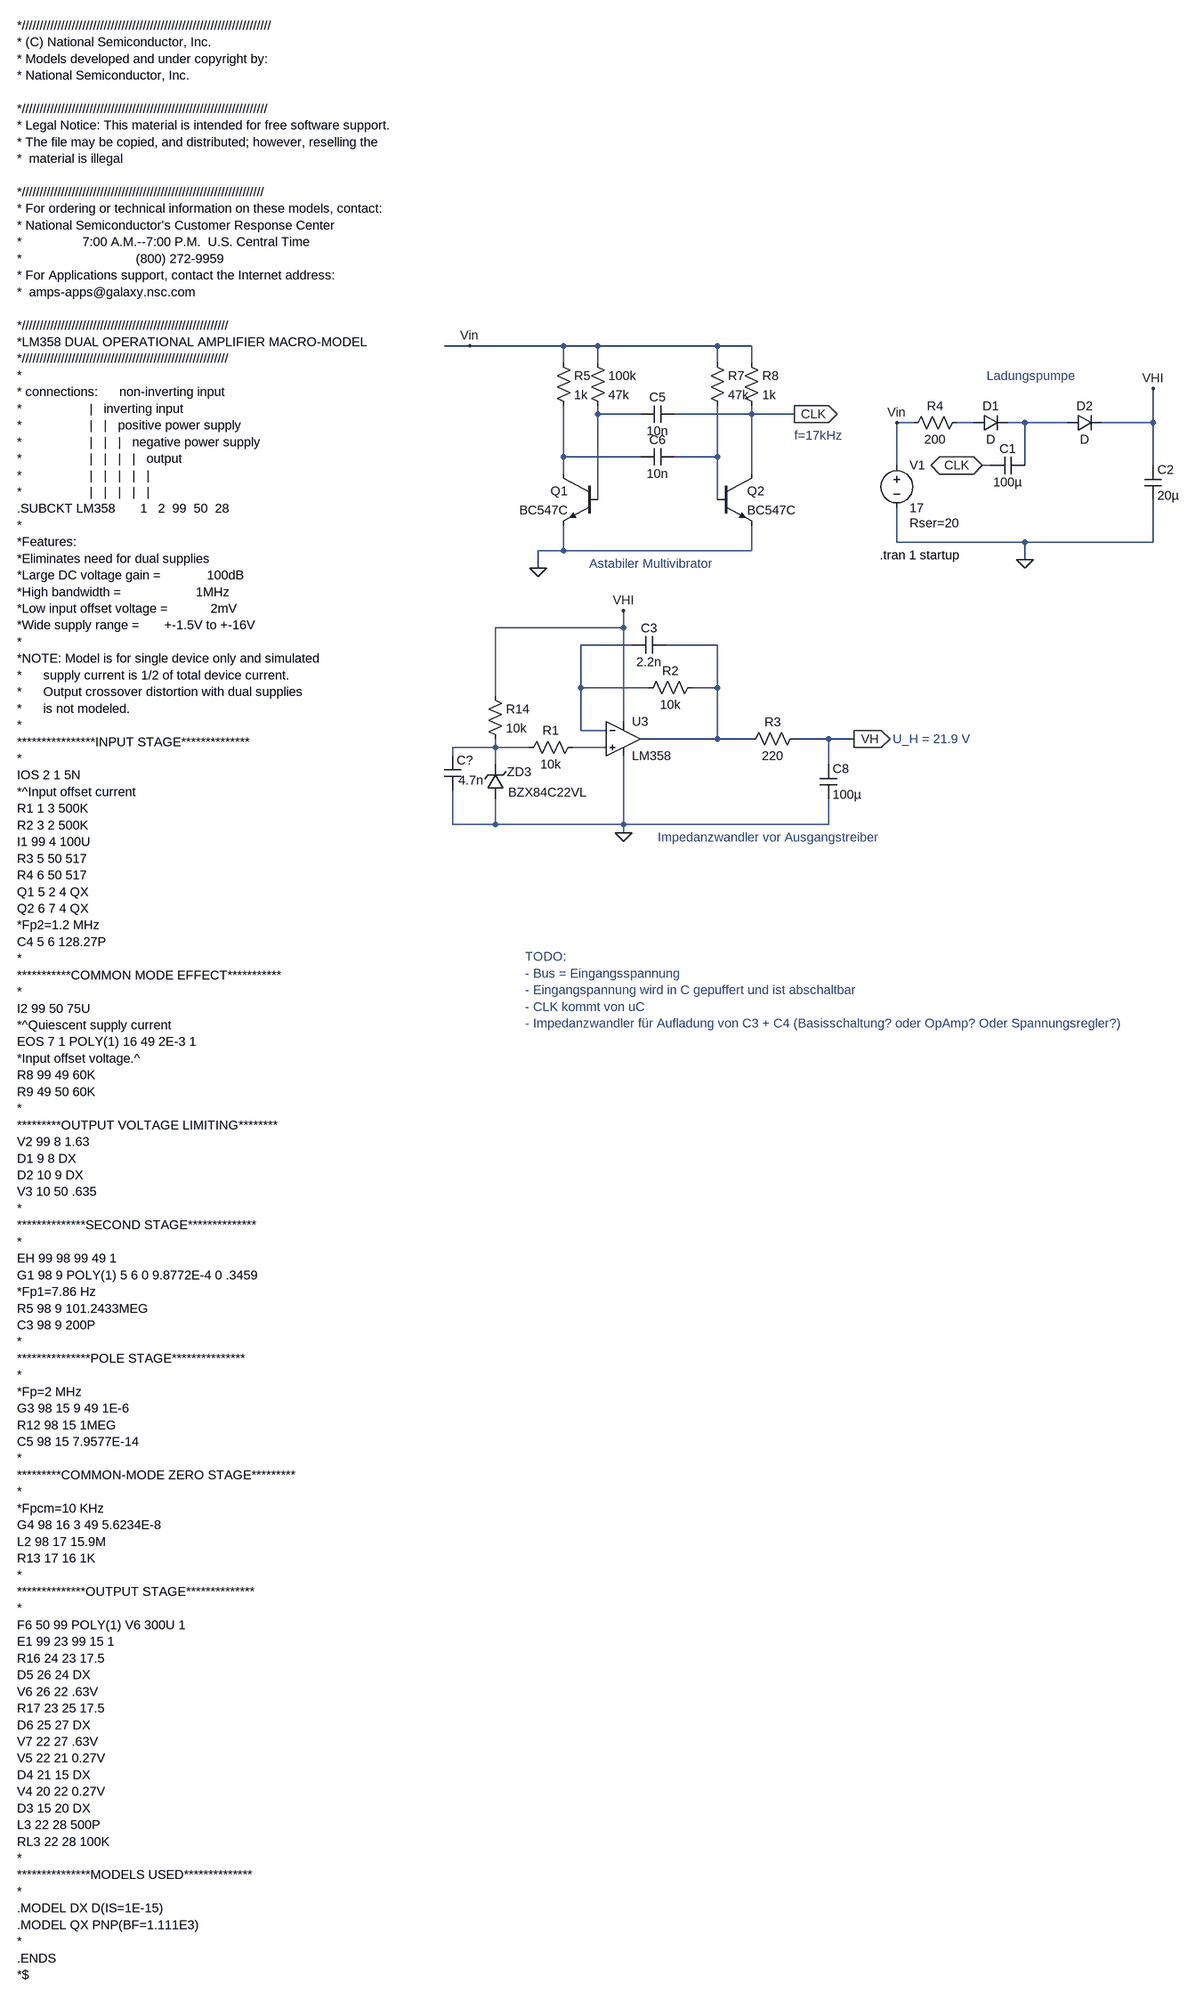
[diagram p0: schematic DriverC2.asc]
DriverC2.asc, the LTspice schematic file:
Version 4
SHEET 1 2516 2612
WIRE -768 -80 -816 -80
WIRE -592 -80 -768 -80
WIRE -528 -80 -592 -80
WIRE -304 -80 -528 -80
WIRE -240 -80 -304 -80
WIRE -592 -48 -592 -80
WIRE -528 -48 -528 -80
WIRE -304 -48 -304 -80
WIRE -240 -48 -240 -80
WIRE -528 48 -528 32
WIRE -448 48 -528 48
WIRE -240 48 -240 32
WIRE -240 48 -384 48
WIRE -160 48 -240 48
WIRE 64 64 32 64
WIRE 176 64 144 64
WIRE 272 64 240 64
WIRE 352 64 272 64
WIRE 512 64 512 0
WIRE 512 64 416 64
WIRE -592 128 -592 32
WIRE -448 128 -592 128
WIRE -304 128 -304 32
WIRE -304 128 -384 128
WIRE 32 144 32 64
WIRE 208 144 192 144
WIRE 272 144 272 64
WIRE 512 144 512 64
WIRE -592 160 -592 128
WIRE -240 160 -240 48
WIRE -528 208 -528 48
WIRE -304 208 -304 128
WIRE 32 288 32 224
WIRE 272 288 32 288
WIRE 512 288 512 208
WIRE 512 288 272 288
WIRE -592 304 -592 256
WIRE -592 304 -640 304
WIRE -240 304 -240 256
WIRE -240 304 -592 304
WIRE 272 320 272 288
WIRE -640 336 -640 304
WIRE -480 448 -480 416
WIRE -480 448 -720 448
WIRE -464 480 -560 480
WIRE -304 480 -400 480
WIRE -560 560 -560 480
WIRE -432 560 -560 560
WIRE -304 560 -304 480
WIRE -304 560 -352 560
WIRE -720 576 -720 448
WIRE -480 624 -480 448
WIRE -560 640 -560 560
WIRE -512 640 -560 640
WIRE -304 656 -304 560
WIRE -304 656 -448 656
WIRE -240 656 -304 656
WIRE -96 656 -160 656
WIRE -48 656 -96 656
WIRE -720 672 -720 656
WIRE -720 672 -800 672
WIRE -656 672 -720 672
WIRE -512 672 -576 672
WIRE -800 688 -800 672
WIRE -720 704 -720 672
WIRE -96 704 -96 656
WIRE -800 816 -800 752
WIRE -720 816 -720 768
WIRE -720 816 -800 816
WIRE -480 816 -480 688
WIRE -480 816 -720 816
WIRE -96 816 -96 768
WIRE -96 816 -480 816
WIRE -480 832 -480 816
FLAG 272 320 0
FLAG 192 144 CLK
IOPIN 192 144 BiDir
FLAG -640 336 0
FLAG -768 -80 Vin
FLAG 32 64 Vin
FLAG -160 48 CLK
IOPIN -160 48 Out
FLAG 512 0 VHI
FLAG -48 656 VH
IOPIN -48 656 Out
FLAG -480 416 VHI
FLAG -480 832 0
SYMBOL voltage 32 128 R0
WINDOW 123 0 0 Left 0
WINDOW 39 24 124 Left 2
SYMATTR SpiceLine Rser=20
SYMATTR InstName V1
SYMATTR Value 17
SYMBOL diode 176 80 R270
WINDOW 0 32 32 VTop 2
WINDOW 3 0 32 VBottom 2
SYMATTR InstName D1
SYMBOL diode 352 80 R270
WINDOW 0 32 32 VTop 2
WINDOW 3 0 32 VBottom 2
SYMATTR InstName D2
SYMBOL cap 272 128 R90
WINDOW 0 0 32 VBottom 2
WINDOW 3 32 32 VTop 2
SYMATTR InstName C1
SYMATTR Value 100µ
SYMBOL cap 496 144 R0
SYMATTR InstName C2
SYMATTR Value 20µ
SYMBOL res 160 48 R90
WINDOW 0 0 56 VBottom 2
WINDOW 3 32 56 VTop 2
SYMATTR InstName R4
SYMATTR Value 200
SYMBOL res -608 -64 R0
SYMATTR InstName R5
SYMATTR Value 1k
SYMBOL res -256 -64 R0
SYMATTR InstName R8
SYMATTR Value 1k
SYMBOL npn -528 160 M0
SYMATTR InstName Q1
SYMATTR Value BC547C
SYMBOL npn -304 160 R0
SYMATTR InstName Q2
SYMATTR Value BC547C
SYMBOL res -544 -64 R0
SYMATTR InstName 100k
SYMATTR Value 47k
SYMBOL res -320 -64 R0
SYMATTR InstName R7
SYMATTR Value 47k
SYMBOL cap -384 32 R90
WINDOW 0 0 32 VBottom 2
WINDOW 3 32 32 VTop 2
SYMATTR InstName C5
SYMATTR Value 10n
SYMBOL cap -384 112 R90
WINDOW 0 0 32 VBottom 2
WINDOW 3 32 32 VTop 2
SYMATTR InstName C6
SYMATTR Value 10n
SYMBOL Opamps\\opamp2 -480 592 R0
SYMATTR InstName U3
SYMATTR Value LM358
SYMATTR SpiceModel LM358
SYMBOL res -736 560 R0
SYMATTR InstName R14
SYMATTR Value 10k
SYMBOL cap -816 688 R0
WINDOW 3 27 46 Left 2
SYMATTR InstName C?
SYMATTR Value 4.7n
SYMBOL res -560 656 R90
WINDOW 0 0 56 VBottom 2
WINDOW 3 32 56 VTop 2
SYMATTR InstName R1
SYMATTR Value 10k
SYMBOL res -336 544 R90
WINDOW 0 0 56 VBottom 2
WINDOW 3 32 56 VTop 2
SYMATTR InstName R2
SYMATTR Value 10k
SYMBOL cap -112 704 R0
SYMATTR InstName C8
SYMATTR Value 100µ
SYMBOL res -144 640 R90
WINDOW 0 0 56 VBottom 2
WINDOW 3 32 56 VTop 2
SYMATTR InstName R3
SYMATTR Value 220
SYMBOL cap -400 464 R90
WINDOW 0 0 32 VBottom 2
WINDOW 3 32 32 VTop 2
SYMATTR InstName C3
SYMATTR Value 2.2n
SYMBOL zener -704 768 R180
WINDOW 0 -52 50 Left 2
WINDOW 3 -155 12 Left 2
SYMATTR InstName ZD3
SYMATTR Value BZX84C22VL
TEXT 0 312 Left 2 !.tran 1 startup
TEXT -544 328 Left 2 ;Astabiler Multivibrator
TEXT 200 -24 Left 2 ;Ladungspumpe
TEXT -160 88 Left 2 ;f=17kHz
TEXT -664 1064 Left 2 ;TODO: \n- Bus = Eingangsspannung\n- Eingangspannung wird in C gepuffert und ist abschaltbar\n- CLK kommt von uC\n- Impedanzwandler für Aufladung von C3 + C4 (Basisschaltung? oder OpAmp? Oder Spannungsregler?)
TEXT -2704 -680 Left 2 !*//////////////////////////////////////////////////////////////////////\n* (C) National Semiconductor, Inc.\n* Models developed and under copyright by:\n* National Semiconductor, Inc.  \n \n*/////////////////////////////////////////////////////////////////////\n* Legal Notice: This material is intended for free software support.\n* The file may be copied, and distributed; however, reselling the \n*  material is illegal\n \n*////////////////////////////////////////////////////////////////////\n* For ordering or technical information on these models, contact:\n* National Semiconductor's Customer Response Center\n*                 7:00 A.M.--7:00 P.M.  U.S. Central Time\n*                                (800) 272-9959\n* For Applications support, contact the Internet address:\n*  amps-apps@galaxy.nsc.com\n \n*//////////////////////////////////////////////////////////\n*LM358 DUAL OPERATIONAL AMPLIFIER MACRO-MODEL\n*//////////////////////////////////////////////////////////\n*\n* connections:      non-inverting input\n*                   |   inverting input\n*                   |   |   positive power supply\n*                   |   |   |   negative power supply\n*                   |   |   |   |   output\n*                   |   |   |   |   |\n*                   |   |   |   |   |\n.SUBCKT LM358       1   2  99  50  28\n*\n*Features:\n*Eliminates need for dual supplies\n*Large DC voltage gain =             100dB\n*High bandwidth =                     1MHz\n*Low input offset voltage =            2mV\n*Wide supply range =       +-1.5V to +-16V\n*\n*NOTE: Model is for single device only and simulated\n*      supply current is 1/2 of total device current.\n*      Output crossover distortion with dual supplies\n*      is not modeled.\n*\n****************INPUT STAGE**************\n*\nIOS 2 1 5N\n*^Input offset current\nR1 1 3 500K\nR2 3 2 500K\nI1 99 4 100U\nR3 5 50 517\nR4 6 50 517\nQ1 5 2 4 QX\nQ2 6 7 4 QX\n*Fp2=1.2 MHz\nC4 5 6 128.27P\n*\n***********COMMON MODE EFFECT***********\n*\nI2 99 50 75U\n*^Quiescent supply current\nEOS 7 1 POLY(1) 16 49 2E-3 1\n*Input offset voltage.^\nR8 99 49 60K\nR9 49 50 60K\n*\n*********OUTPUT VOLTAGE LIMITING********\nV2 99 8 1.63\nD1 9 8 DX\nD2 10 9 DX\nV3 10 50 .635\n*\n**************SECOND STAGE**************\n*\nEH 99 98 99 49 1\nG1 98 9 POLY(1) 5 6 0 9.8772E-4 0 .3459\n*Fp1=7.86 Hz\nR5 98 9 101.2433MEG\nC3 98 9 200P\n*\n***************POLE STAGE***************\n*\n*Fp=2 MHz\nG3 98 15 9 49 1E-6\nR12 98 15 1MEG\nC5 98 15 7.9577E-14\n*\n*********COMMON-MODE ZERO STAGE*********\n*\n*Fpcm=10 KHz\nG4 98 16 3 49 5.6234E-8               \nL2 98 17 15.9M\nR13 17 16 1K\n*\n**************OUTPUT STAGE**************\n*\nF6 50 99 POLY(1) V6 300U 1\nE1 99 23 99 15 1\nR16 24 23 17.5\nD5 26 24 DX\nV6 26 22 .63V\nR17 23 25 17.5\nD6 25 27 DX\nV7 22 27 .63V\nV5 22 21 0.27V\nD4 21 15 DX\nV4 20 22 0.27V\nD3 15 20 DX\nL3 22 28 500P\nRL3 22 28 100K\n*\n***************MODELS USED**************\n*\n.MODEL DX D(IS=1E-15)\n.MODEL QX PNP(BF=1.111E3)\n*\n.ENDS\n*$
TEXT 24 656 Left 2 ;U_H = 21.9 V
TEXT -416 840 Left 2 ;Impedanzwandler vor Ausgangstreiber

The netlist it stands for:
* DriverC2.asc
V1 Vin 0 17 Rser=20
D1 N002 N003 D
D2 N003 VHI D
C1 N003 CLK 100µ
C2 VHI 0 20µ
R4 N002 Vin 200
R5 Vin N004 1k
R8 Vin CLK 1k
Q1 N004 N001 0 0 BC547C
Q2 CLK N005 0 0 BC547C
R§100k Vin N001 47k
R7 Vin N005 47k
C5 CLK N001 10n
C6 N005 N004 10n
XU3 N009 N006 VHI 0 N007 LM358 LM358  ; pins In+ In- V+ V- OUT
R14 VHI N008 10k
C? N008 0 4.7n
R1 N009 N008 10k
R2 N007 N006 10k
C8 VH 0 100µ
R3 VH N007 220
C3 N007 N006 2.2n
D§ZD3 0 N008 BZX84C22VL
.model D D
.lib standard.dio
.model NPN NPN
.model PNP PNP
.lib standard.bjt
.tran 1 startup
* Astabiler Multivibrator
* Ladungspumpe
* f=17kHz
* TODO:
* - Bus = Eingangsspannung
* - Eingangspannung wird in C gepuffert und ist abschaltbar
* - CLK kommt von uC
* - Impedanzwandler für Aufladung von C3 + C4 (Basisschaltung? oder OpAmp? Oder Spannungsregler?)
*//////////////////////////////////////////////////////////////////////
* (C) National Semiconductor, Inc.
* Models developed and under copyright by:
* National Semiconductor, Inc.
*/////////////////////////////////////////////////////////////////////
* Legal Notice: This material is intended for free software support.
* The file may be copied, and distributed; however, reselling the
*  material is illegal
*////////////////////////////////////////////////////////////////////
* For ordering or technical information on these models, contact:
* National Semiconductor's Customer Response Center
*                 7:00 A.M.--7:00 P.M.  U.S. Central Time
*                                (800) 272-9959
* For Applications support, contact the Internet address:
*  amps-apps@galaxy.nsc.com
*//////////////////////////////////////////////////////////
*LM358 DUAL OPERATIONAL AMPLIFIER MACRO-MODEL
*//////////////////////////////////////////////////////////
*
* connections:      non-inverting input
*                   |   inverting input
*                   |   |   positive power supply
*                   |   |   |   negative power supply
*                   |   |   |   |   output
*                   |   |   |   |   |
*                   |   |   |   |   |
.SUBCKT LM358       1   2  99  50  28
*
*Features:
*Eliminates need for dual supplies
*Large DC voltage gain =             100dB
*High bandwidth =                     1MHz
*Low input offset voltage =            2mV
*Wide supply range =       +-1.5V to +-16V
*
*NOTE: Model is for single device only and simulated
*      supply current is 1/2 of total device current.
*      Output crossover distortion with dual supplies
*      is not modeled.
*
****************INPUT STAGE**************
*
IOS 2 1 5N
*^Input offset current
R1 1 3 500K
R2 3 2 500K
I1 99 4 100U
R3 5 50 517
R4 6 50 517
Q1 5 2 4 QX
Q2 6 7 4 QX
*Fp2=1.2 MHz
C4 5 6 128.27P
*
***********COMMON MODE EFFECT***********
*
I2 99 50 75U
*^Quiescent supply current
EOS 7 1 POLY(1) 16 49 2E-3 1
*Input offset voltage.^
R8 99 49 60K
R9 49 50 60K
*
*********OUTPUT VOLTAGE LIMITING********
V2 99 8 1.63
D1 9 8 DX
D2 10 9 DX
V3 10 50 .635
*
**************SECOND STAGE**************
*
EH 99 98 99 49 1
G1 98 9 POLY(1) 5 6 0 9.8772E-4 0 .3459
*Fp1=7.86 Hz
R5 98 9 101.2433MEG
C3 98 9 200P
*
***************POLE STAGE***************
*
*Fp=2 MHz
G3 98 15 9 49 1E-6
R12 98 15 1MEG
C5 98 15 7.9577E-14
*
*********COMMON-MODE ZERO STAGE*********
*
*Fpcm=10 KHz
G4 98 16 3 49 5.6234E-8
L2 98 17 15.9M
R13 17 16 1K
*
**************OUTPUT STAGE**************
*
F6 50 99 POLY(1) V6 300U 1
E1 99 23 99 15 1
R16 24 23 17.5
D5 26 24 DX
V6 26 22 .63V
R17 23 25 17.5
D6 25 27 DX
V7 22 27 .63V
V5 22 21 0.27V
D4 21 15 DX
V4 20 22 0.27V
D3 15 20 DX
L3 22 28 500P
RL3 22 28 100K
*
***************MODELS USED**************
*
.MODEL DX D(IS=1E-15)
.MODEL QX PNP(BF=1.111E3)
*
.ENDS
*$
* U_H = 21.9 V
* Impedanzwandler vor Ausgangstreiber
.backanno
.end